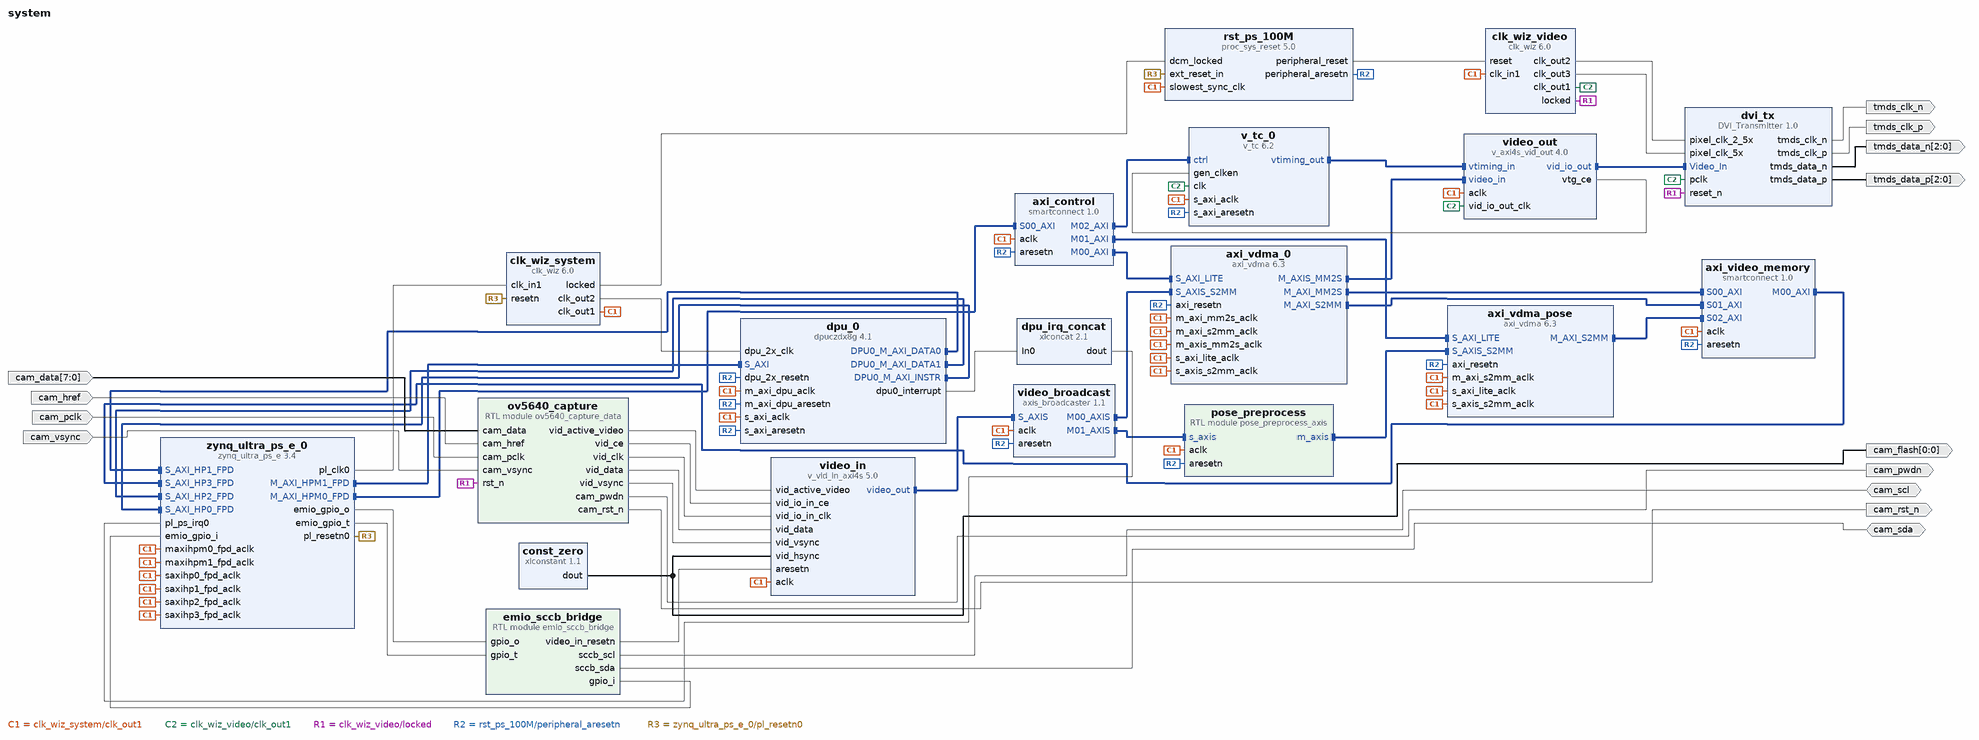
[diagram p0: block diagram of the top level]
# Vivado block design system, xczu4ev-sfvc784-2-i, Vivado 2022.2
create_bd_design system

create_bd_port -dir I -from 7 -to 0 cam_data
create_bd_port -dir I -type clk cam_pclk
set_property -dict {CONFIG.FREQ_HZ 72000000} [get_bd_ports cam_pclk]
create_bd_port -dir I cam_vsync
create_bd_port -dir I cam_href
create_bd_port -dir O -type rst cam_rst_n
create_bd_port -dir O cam_pwdn
create_bd_port -dir O -from 0 -to 0 cam_flash
create_bd_port -dir IO cam_scl
create_bd_port -dir IO cam_sda
create_bd_port -dir O tmds_clk_p
create_bd_port -dir O tmds_clk_n
create_bd_port -dir O -from 2 -to 0 tmds_data_p
create_bd_port -dir O -from 2 -to 0 tmds_data_n

create_bd_cell -type ip -vlnv xilinx.com:ip:zynq_ultra_ps_e:3.4 zynq_ultra_ps_e_0
set_property -dict [list \
  CONFIG.PSU_BANK_0_IO_STANDARD LVCMOS18 \
  CONFIG.PSU_BANK_1_IO_STANDARD LVCMOS33 \
  CONFIG.PSU_BANK_2_IO_STANDARD LVCMOS18 \
  CONFIG.PSU_BANK_3_IO_STANDARD LVCMOS33 \
  CONFIG.PSU__CRF_APB__DDR_CTRL__FREQMHZ 1066 \
  CONFIG.PSU__CRF_APB__DDR_CTRL__SRCSEL DPLL \
  CONFIG.PSU__CRL_APB__PL0_REF_CTRL__FREQMHZ 100.004023 \
  CONFIG.PSU__CRL_APB__SDIO1_REF_CTRL__FREQMHZ 200 \
  CONFIG.PSU__CRL_APB__SDIO1_REF_CTRL__SRCSEL IOPLL \
  CONFIG.PSU__DDRC__BUS_WIDTH {64 Bit} \
  CONFIG.PSU__DDRC__COMPONENTS Components \
  CONFIG.PSU__DDRC__DEVICE_CAPACITY {4096 MBits} \
  CONFIG.PSU__DDRC__DRAM_WIDTH {16 Bits} \
  CONFIG.PSU__DDRC__ECC Disabled \
  CONFIG.PSU__DDRC__MEMORY_TYPE {DDR 4} \
  CONFIG.PSU__DDRC__SPEED_BIN DDR4_2400P \
  CONFIG.PSU__DDR_HIGH_ADDRESS_GUI_ENABLE 0 \
  CONFIG.PSU__DDR__INTERFACE__FREQMHZ 533.000 \
  CONFIG.PSU__DLL__ISUSED 1 \
  CONFIG.PSU__FPGA_PL0_ENABLE 1 \
  CONFIG.PSU__GPIO_EMIO_WIDTH 95 \
  CONFIG.PSU__GPIO_EMIO__PERIPHERAL__ENABLE 1 \
  CONFIG.PSU__GPIO_EMIO__PERIPHERAL__IO 95 \
  CONFIG.PSU__MAXIGP0__DATA_WIDTH 32 \
  CONFIG.PSU__MAXIGP1__DATA_WIDTH 32 \
  CONFIG.PSU__SAXIGP2__DATA_WIDTH 32 \
  CONFIG.PSU__SD1_COHERENCY 0 \
  CONFIG.PSU__SD1_ROUTE_THROUGH_FPD 0 \
  CONFIG.PSU__SD1__CLK_50_SDR_ITAP_DLY 0x15 \
  CONFIG.PSU__SD1__CLK_50_SDR_OTAP_DLY 0x5 \
  CONFIG.PSU__SD1__DATA_TRANSFER_MODE 4Bit \
  CONFIG.PSU__SD1__GRP_CD__ENABLE 1 \
  CONFIG.PSU__SD1__GRP_CD__IO {MIO 45} \
  CONFIG.PSU__SD1__GRP_POW__ENABLE 0 \
  CONFIG.PSU__SD1__GRP_WP__ENABLE 0 \
  CONFIG.PSU__SD1__PERIPHERAL__ENABLE 1 \
  CONFIG.PSU__SD1__PERIPHERAL__IO {MIO 46 .. 51} \
  CONFIG.PSU__SD1__SLOT_TYPE {SD 2.0} \
  CONFIG.PSU__UART0__BAUD_RATE 115200 \
  CONFIG.PSU__UART0__MODEM__ENABLE 0 \
  CONFIG.PSU__UART0__PERIPHERAL__ENABLE 1 \
  CONFIG.PSU__UART0__PERIPHERAL__IO {MIO 42 .. 43} \
  CONFIG.PSU__USE__DDR_INTF_REQUESTED 1 \
  CONFIG.PSU__USE__IRQ0 1 \
  CONFIG.PSU__USE__M_AXI_GP0 1 \
  CONFIG.PSU__USE__M_AXI_GP1 1 \
  CONFIG.PSU__USE__M_AXI_GP2 0 \
  CONFIG.PSU__USE__S_AXI_GP2 1 \
  CONFIG.PSU__USE__S_AXI_GP3 1 \
  CONFIG.PSU__USE__S_AXI_GP4 1 \
  CONFIG.PSU__USE__S_AXI_GP5 1 \
] [get_bd_cells zynq_ultra_ps_e_0]
# 65 more settings of zynq_ultra_ps_e_0 are not shown: defaults, MIO pin electricals, DDR timing, and values the tool derives
create_bd_cell -type ip -vlnv xilinx.com:ip:proc_sys_reset:5.0 rst_ps_100M
create_bd_cell -type ip -vlnv xilinx.com:ip:clk_wiz:6.0 clk_wiz_system
set_property -dict [list \
  CONFIG.CLKOUT1_REQUESTED_OUT_FREQ 100.000 \
  CONFIG.CLKOUT2_REQUESTED_OUT_FREQ 200.000 \
  CONFIG.CLKOUT2_USED true \
  CONFIG.NUM_OUT_CLKS 2 \
  CONFIG.PRIM_SOURCE No_buffer \
  CONFIG.RESET_TYPE ACTIVE_LOW \
] [get_bd_cells clk_wiz_system]
create_bd_cell -type ip -vlnv xilinx.com:ip:clk_wiz:6.0 clk_wiz_video
set_property -dict [list \
  CONFIG.CLKOUT1_REQUESTED_OUT_FREQ 75.000 \
  CONFIG.CLKOUT2_REQUESTED_OUT_FREQ 187.500 \
  CONFIG.CLKOUT2_USED true \
  CONFIG.CLKOUT3_REQUESTED_OUT_FREQ 375.000 \
  CONFIG.CLKOUT3_USED true \
  CONFIG.MMCM_CLKFBOUT_MULT_F 11.250 \
  CONFIG.MMCM_CLKOUT0_DIVIDE_F 15.000 \
  CONFIG.MMCM_CLKOUT1_DIVIDE 6 \
  CONFIG.MMCM_CLKOUT2_DIVIDE 3 \
  CONFIG.MMCM_DIVCLK_DIVIDE 1 \
  CONFIG.NUM_OUT_CLKS 3 \
  CONFIG.OVERRIDE_MMCM true \
  CONFIG.PRIM_SOURCE No_buffer \
  CONFIG.RESET_TYPE ACTIVE_HIGH \
] [get_bd_cells clk_wiz_video]
create_bd_cell -type ip -vlnv xilinx.com:ip:smartconnect:1.0 axi_control
set_property -dict {CONFIG.NUM_MI 3 CONFIG.NUM_SI 1} [get_bd_cells axi_control]
create_bd_cell -type ip -vlnv xilinx.com:ip:smartconnect:1.0 axi_video_memory
set_property -dict {CONFIG.NUM_MI 1 CONFIG.NUM_SI 3} [get_bd_cells axi_video_memory]
create_bd_cell -type ip -vlnv xilinx.com:ip:axi_vdma:6.3 axi_vdma_0
set_property -dict [list \
  CONFIG.c_include_s2mm 1 \
  CONFIG.c_m_axi_mm2s_data_width 64 \
  CONFIG.c_m_axi_s2mm_data_width 64 \
  CONFIG.c_m_axis_mm2s_tdata_width 24 \
  CONFIG.c_mm2s_linebuffer_depth 2048 \
  CONFIG.c_mm2s_max_burst_length 64 \
  CONFIG.c_num_fstores 3 \
  CONFIG.c_s2mm_genlock_mode 2 \
  CONFIG.c_s2mm_linebuffer_depth 2048 \
  CONFIG.c_s2mm_max_burst_length 64 \
] [get_bd_cells axi_vdma_0]
create_bd_cell -type ip -vlnv xilinx.com:ip:axi_vdma:6.3 axi_vdma_pose
set_property -dict [list \
  CONFIG.c_flush_on_fsync 1 \
  CONFIG.c_include_mm2s 0 \
  CONFIG.c_include_s2mm 1 \
  CONFIG.c_include_s2mm_sf 1 \
  CONFIG.c_m_axi_s2mm_data_width 64 \
  CONFIG.c_num_fstores 3 \
  CONFIG.c_s2mm_linebuffer_depth 512 \
  CONFIG.c_s2mm_max_burst_length 64 \
  CONFIG.c_s2mm_sof_enable 1 \
  CONFIG.c_use_fsync 1 \
  CONFIG.c_use_s2mm_fsync 2 \
] [get_bd_cells axi_vdma_pose]
create_bd_cell -type ip -vlnv xilinx.com:ip:v_vid_in_axi4s:5.0 video_in
set_property -dict {CONFIG.C_HAS_ASYNC_CLK 1} [get_bd_cells video_in]
create_bd_cell -type ip -vlnv xilinx.com:ip:axis_broadcaster:1.1 video_broadcast
set_property -dict [list \
  CONFIG.HAS_TLAST 1 \
  CONFIG.HAS_TREADY 1 \
  CONFIG.M_TDATA_NUM_BYTES 3 \
  CONFIG.M_TUSER_WIDTH 1 \
  CONFIG.NUM_MI 2 \
  CONFIG.S_TDATA_NUM_BYTES 3 \
  CONFIG.S_TUSER_WIDTH 1 \
] [get_bd_cells video_broadcast]
create_bd_cell -type module -reference pose_preprocess_axis pose_preprocess
create_bd_cell -type module -reference ov5640_capture_data ov5640_capture
create_bd_cell -type ip -vlnv xilinx.com:ip:v_axi4s_vid_out:4.0 video_out
set_property -dict {CONFIG.C_HAS_ASYNC_CLK 1} [get_bd_cells video_out]
create_bd_cell -type ip -vlnv xilinx.com:ip:v_tc:6.2 v_tc_0
set_property -dict {CONFIG.enable_detection false} [get_bd_cells v_tc_0]
create_bd_cell -type ip -vlnv openedv.com:user:DVI_Transmitter:1.0 dvi_tx
create_bd_cell -type ip -vlnv xilinx.com:ip:dpuczdx8g:4.1 dpu_0
set_property -dict [list \
  CONFIG.ARCH 4096 \
  CONFIG.ARCH_HP_BW 3 \
  CONFIG.ARCH_IMG_BKGRP 2 \
  CONFIG.AXI_PROTOCOL 1 \
  CONFIG.CONV_DSP_ACCU_ENA 0 \
  CONFIG.SFM_ENA 0 \
  CONFIG.S_AXI_CLK_INDEPENDENT 1 \
  CONFIG.TIME_DAY 21 \
  CONFIG.TIME_HOUR 23 \
  CONFIG.TIME_MONTH 9 \
  CONFIG.TIME_QUARTER 0 \
  CONFIG.TIME_YEAR 26 \
  CONFIG.URAM_N_USER 40 \
] [get_bd_cells dpu_0]
create_bd_cell -type ip -vlnv xilinx.com:ip:xlconcat:2.1 dpu_irq_concat
set_property -dict {CONFIG.NUM_PORTS 1} [get_bd_cells dpu_irq_concat]
create_bd_cell -type ip -vlnv xilinx.com:ip:xlconstant:1.1 const_zero
set_property -dict {CONFIG.CONST_VAL 0 CONFIG.CONST_WIDTH 1} [get_bd_cells const_zero]
create_bd_cell -type module -reference emio_sccb_bridge emio_sccb_bridge

# ---- connections ----

connect_bd_intf_net [get_bd_intf_pins axi_control/M00_AXI] [get_bd_intf_pins axi_vdma_0/S_AXI_LITE]
connect_bd_intf_net [get_bd_intf_pins axi_control/M01_AXI] [get_bd_intf_pins axi_vdma_pose/S_AXI_LITE]
connect_bd_intf_net [get_bd_intf_pins axi_control/M02_AXI] [get_bd_intf_pins v_tc_0/ctrl]
connect_bd_intf_net [get_bd_intf_pins axi_vdma_0/M_AXIS_MM2S] [get_bd_intf_pins video_out/video_in]
connect_bd_intf_net [get_bd_intf_pins axi_vdma_0/M_AXI_MM2S] [get_bd_intf_pins axi_video_memory/S00_AXI]
connect_bd_intf_net [get_bd_intf_pins axi_vdma_0/M_AXI_S2MM] [get_bd_intf_pins axi_video_memory/S01_AXI]
connect_bd_intf_net [get_bd_intf_pins axi_vdma_pose/M_AXI_S2MM] [get_bd_intf_pins axi_video_memory/S02_AXI]
connect_bd_intf_net [get_bd_intf_pins axi_video_memory/M00_AXI] [get_bd_intf_pins zynq_ultra_ps_e_0/S_AXI_HP3_FPD]
connect_bd_intf_net [get_bd_intf_pins dpu_0/DPU0_M_AXI_DATA0] [get_bd_intf_pins zynq_ultra_ps_e_0/S_AXI_HP1_FPD]
connect_bd_intf_net [get_bd_intf_pins dpu_0/DPU0_M_AXI_DATA1] [get_bd_intf_pins zynq_ultra_ps_e_0/S_AXI_HP2_FPD]
connect_bd_intf_net [get_bd_intf_pins dpu_0/DPU0_M_AXI_INSTR] [get_bd_intf_pins zynq_ultra_ps_e_0/S_AXI_HP0_FPD]
connect_bd_intf_net [get_bd_intf_pins pose_preprocess/m_axis] [get_bd_intf_pins axi_vdma_pose/S_AXIS_S2MM]
connect_bd_intf_net [get_bd_intf_pins v_tc_0/vtiming_out] [get_bd_intf_pins video_out/vtiming_in]
connect_bd_intf_net [get_bd_intf_pins video_broadcast/M00_AXIS] [get_bd_intf_pins axi_vdma_0/S_AXIS_S2MM]
connect_bd_intf_net [get_bd_intf_pins video_broadcast/M01_AXIS] [get_bd_intf_pins pose_preprocess/s_axis]
connect_bd_intf_net [get_bd_intf_pins video_in/video_out] [get_bd_intf_pins video_broadcast/S_AXIS]
connect_bd_intf_net [get_bd_intf_pins video_out/vid_io_out] [get_bd_intf_pins dvi_tx/Video_In]
connect_bd_intf_net [get_bd_intf_pins zynq_ultra_ps_e_0/M_AXI_HPM0_FPD] [get_bd_intf_pins axi_control/S00_AXI]
connect_bd_intf_net [get_bd_intf_pins zynq_ultra_ps_e_0/M_AXI_HPM1_FPD] [get_bd_intf_pins dpu_0/S_AXI]
connect_bd_net [get_bd_ports cam_scl] [get_bd_pins emio_sccb_bridge/sccb_scl]
connect_bd_net [get_bd_ports cam_sda] [get_bd_pins emio_sccb_bridge/sccb_sda]
connect_bd_net [get_bd_ports cam_data] [get_bd_pins ov5640_capture/cam_data]
connect_bd_net [get_bd_ports cam_href] [get_bd_pins ov5640_capture/cam_href]
connect_bd_net [get_bd_ports cam_pclk] [get_bd_pins ov5640_capture/cam_pclk]
connect_bd_net [get_bd_ports cam_vsync] [get_bd_pins ov5640_capture/cam_vsync]
connect_bd_net [get_bd_pins clk_wiz_system/clk_out1] \
  [get_bd_pins zynq_ultra_ps_e_0/maxihpm0_fpd_aclk] [get_bd_pins zynq_ultra_ps_e_0/maxihpm1_fpd_aclk] \
  [get_bd_pins zynq_ultra_ps_e_0/saxihp0_fpd_aclk] [get_bd_pins zynq_ultra_ps_e_0/saxihp1_fpd_aclk] \
  [get_bd_pins zynq_ultra_ps_e_0/saxihp2_fpd_aclk] [get_bd_pins zynq_ultra_ps_e_0/saxihp3_fpd_aclk] \
  [get_bd_pins rst_ps_100M/slowest_sync_clk] [get_bd_pins axi_control/aclk] [get_bd_pins axi_video_memory/aclk] \
  [get_bd_pins axi_vdma_0/s_axi_lite_aclk] [get_bd_pins axi_vdma_0/m_axi_mm2s_aclk] [get_bd_pins axi_vdma_0/m_axi_s2mm_aclk] \
  [get_bd_pins axi_vdma_0/m_axis_mm2s_aclk] [get_bd_pins axi_vdma_0/s_axis_s2mm_aclk] \
  [get_bd_pins axi_vdma_pose/s_axi_lite_aclk] [get_bd_pins axi_vdma_pose/m_axi_s2mm_aclk] \
  [get_bd_pins axi_vdma_pose/s_axis_s2mm_aclk] [get_bd_pins video_in/aclk] [get_bd_pins video_broadcast/aclk] \
  [get_bd_pins pose_preprocess/aclk] [get_bd_pins video_out/aclk] [get_bd_pins v_tc_0/s_axi_aclk] \
  [get_bd_pins dpu_0/s_axi_aclk] [get_bd_pins dpu_0/m_axi_dpu_aclk] [get_bd_pins clk_wiz_video/clk_in1]
connect_bd_net [get_bd_pins clk_wiz_system/clk_out2] [get_bd_pins dpu_0/dpu_2x_clk]
connect_bd_net [get_bd_pins clk_wiz_system/locked] [get_bd_pins rst_ps_100M/dcm_locked]
connect_bd_net [get_bd_pins clk_wiz_video/clk_out1] [get_bd_pins video_out/vid_io_out_clk] [get_bd_pins v_tc_0/clk] [get_bd_pins dvi_tx/pclk]
connect_bd_net [get_bd_pins clk_wiz_video/clk_out2] [get_bd_pins dvi_tx/pixel_clk_2_5x]
connect_bd_net [get_bd_pins clk_wiz_video/clk_out3] [get_bd_pins dvi_tx/pixel_clk_5x]
connect_bd_net [get_bd_pins clk_wiz_video/locked] [get_bd_pins dvi_tx/reset_n] [get_bd_pins ov5640_capture/rst_n]
connect_bd_net [get_bd_pins const_zero/dout] [get_bd_ports cam_flash] [get_bd_pins video_in/vid_hsync]
connect_bd_net [get_bd_pins dpu_0/dpu0_interrupt] [get_bd_pins dpu_irq_concat/In0]
connect_bd_net [get_bd_pins dpu_irq_concat/dout] [get_bd_pins zynq_ultra_ps_e_0/pl_ps_irq0]
connect_bd_net [get_bd_pins dvi_tx/tmds_clk_n] [get_bd_ports tmds_clk_n]
connect_bd_net [get_bd_pins dvi_tx/tmds_clk_p] [get_bd_ports tmds_clk_p]
connect_bd_net [get_bd_pins dvi_tx/tmds_data_n] [get_bd_ports tmds_data_n]
connect_bd_net [get_bd_pins dvi_tx/tmds_data_p] [get_bd_ports tmds_data_p]
connect_bd_net [get_bd_pins emio_sccb_bridge/gpio_i] [get_bd_pins zynq_ultra_ps_e_0/emio_gpio_i]
connect_bd_net [get_bd_pins emio_sccb_bridge/video_in_resetn] [get_bd_pins video_in/aresetn]
connect_bd_net [get_bd_pins ov5640_capture/cam_pwdn] [get_bd_ports cam_pwdn]
connect_bd_net [get_bd_pins ov5640_capture/cam_rst_n] [get_bd_ports cam_rst_n]
connect_bd_net [get_bd_pins ov5640_capture/vid_active_video] [get_bd_pins video_in/vid_active_video]
connect_bd_net [get_bd_pins ov5640_capture/vid_ce] [get_bd_pins video_in/vid_io_in_ce]
connect_bd_net [get_bd_pins ov5640_capture/vid_clk] [get_bd_pins video_in/vid_io_in_clk]
connect_bd_net [get_bd_pins ov5640_capture/vid_data] [get_bd_pins video_in/vid_data]
connect_bd_net [get_bd_pins ov5640_capture/vid_vsync] [get_bd_pins video_in/vid_vsync]
connect_bd_net [get_bd_pins rst_ps_100M/peripheral_aresetn] \
  [get_bd_pins axi_control/aresetn] [get_bd_pins axi_video_memory/aresetn] [get_bd_pins axi_vdma_0/axi_resetn] \
  [get_bd_pins axi_vdma_pose/axi_resetn] [get_bd_pins video_broadcast/aresetn] [get_bd_pins pose_preprocess/aresetn] \
  [get_bd_pins v_tc_0/s_axi_aresetn] [get_bd_pins dpu_0/s_axi_aresetn] [get_bd_pins dpu_0/m_axi_dpu_aresetn] \
  [get_bd_pins dpu_0/dpu_2x_resetn]
connect_bd_net [get_bd_pins rst_ps_100M/peripheral_reset] [get_bd_pins clk_wiz_video/reset]
connect_bd_net [get_bd_pins video_out/vtg_ce] [get_bd_pins v_tc_0/gen_clken]
connect_bd_net [get_bd_pins zynq_ultra_ps_e_0/emio_gpio_o] [get_bd_pins emio_sccb_bridge/gpio_o]
connect_bd_net [get_bd_pins zynq_ultra_ps_e_0/emio_gpio_t] [get_bd_pins emio_sccb_bridge/gpio_t]
connect_bd_net [get_bd_pins zynq_ultra_ps_e_0/pl_clk0] [get_bd_pins clk_wiz_system/clk_in1]
connect_bd_net [get_bd_pins zynq_ultra_ps_e_0/pl_resetn0] [get_bd_pins clk_wiz_system/resetn] [get_bd_pins rst_ps_100M/ext_reset_in]

# ---- address map ----
assign_bd_address -offset 0x00000000 -range 2G -target_address_space [get_bd_addr_spaces axi_vdma_0/Data_MM2S] [get_bd_addr_segs zynq_ultra_ps_e_0/SAXIGP5/HP3_DDR_LOW]
exclude_bd_addr_seg -offset 0xFF000000 -range 16M -target_address_space [get_bd_addr_spaces axi_vdma_0/Data_MM2S] [get_bd_addr_segs zynq_ultra_ps_e_0/SAXIGP5/HP3_LPS_OCM]
assign_bd_address -offset 0x00000000 -range 2G -target_address_space [get_bd_addr_spaces axi_vdma_0/Data_S2MM] [get_bd_addr_segs zynq_ultra_ps_e_0/SAXIGP5/HP3_DDR_LOW]
exclude_bd_addr_seg -offset 0xFF000000 -range 16M -target_address_space [get_bd_addr_spaces axi_vdma_0/Data_S2MM] [get_bd_addr_segs zynq_ultra_ps_e_0/SAXIGP5/HP3_LPS_OCM]
assign_bd_address -offset 0x00000000 -range 2G -target_address_space [get_bd_addr_spaces axi_vdma_pose/Data_S2MM] [get_bd_addr_segs zynq_ultra_ps_e_0/SAXIGP5/HP3_DDR_LOW]
exclude_bd_addr_seg -offset 0xFF000000 -range 16M -target_address_space [get_bd_addr_spaces axi_vdma_pose/Data_S2MM] [get_bd_addr_segs zynq_ultra_ps_e_0/SAXIGP5/HP3_LPS_OCM]
assign_bd_address -offset 0x0000000000 -range 2G -target_address_space [get_bd_addr_spaces dpu_0/DPU0_M_AXI_DATA0] [get_bd_addr_segs zynq_ultra_ps_e_0/SAXIGP3/HP1_DDR_LOW]
assign_bd_address -offset 0x00FF000000 -range 16M -target_address_space [get_bd_addr_spaces dpu_0/DPU0_M_AXI_DATA0] [get_bd_addr_segs zynq_ultra_ps_e_0/SAXIGP3/HP1_LPS_OCM]
assign_bd_address -offset 0x0000000000 -range 2G -target_address_space [get_bd_addr_spaces dpu_0/DPU0_M_AXI_DATA1] [get_bd_addr_segs zynq_ultra_ps_e_0/SAXIGP4/HP2_DDR_LOW]
assign_bd_address -offset 0x00FF000000 -range 16M -target_address_space [get_bd_addr_spaces dpu_0/DPU0_M_AXI_DATA1] [get_bd_addr_segs zynq_ultra_ps_e_0/SAXIGP4/HP2_LPS_OCM]
assign_bd_address -offset 0x0000000000 -range 2G -target_address_space [get_bd_addr_spaces dpu_0/DPU0_M_AXI_INSTR] [get_bd_addr_segs zynq_ultra_ps_e_0/SAXIGP2/HP0_DDR_LOW]
assign_bd_address -offset 0x00FF000000 -range 16M -target_address_space [get_bd_addr_spaces dpu_0/DPU0_M_AXI_INSTR] [get_bd_addr_segs zynq_ultra_ps_e_0/SAXIGP2/HP0_LPS_OCM]
assign_bd_address -offset 0x00A0000000 -range 64K -target_address_space [get_bd_addr_spaces zynq_ultra_ps_e_0/Data] [get_bd_addr_segs axi_vdma_0/S_AXI_LITE/Reg]
assign_bd_address -offset 0x00A0010000 -range 64K -target_address_space [get_bd_addr_spaces zynq_ultra_ps_e_0/Data] [get_bd_addr_segs axi_vdma_pose/S_AXI_LITE/Reg]
assign_bd_address -offset 0x00A0020000 -range 64K -target_address_space [get_bd_addr_spaces zynq_ultra_ps_e_0/Data] [get_bd_addr_segs v_tc_0/ctrl/Reg]
assign_bd_address -offset 0x0500000000 -range 16M -target_address_space [get_bd_addr_spaces zynq_ultra_ps_e_0/Data] [get_bd_addr_segs dpu_0/S_AXI/reg0]

validate_bd_design
save_bd_design
